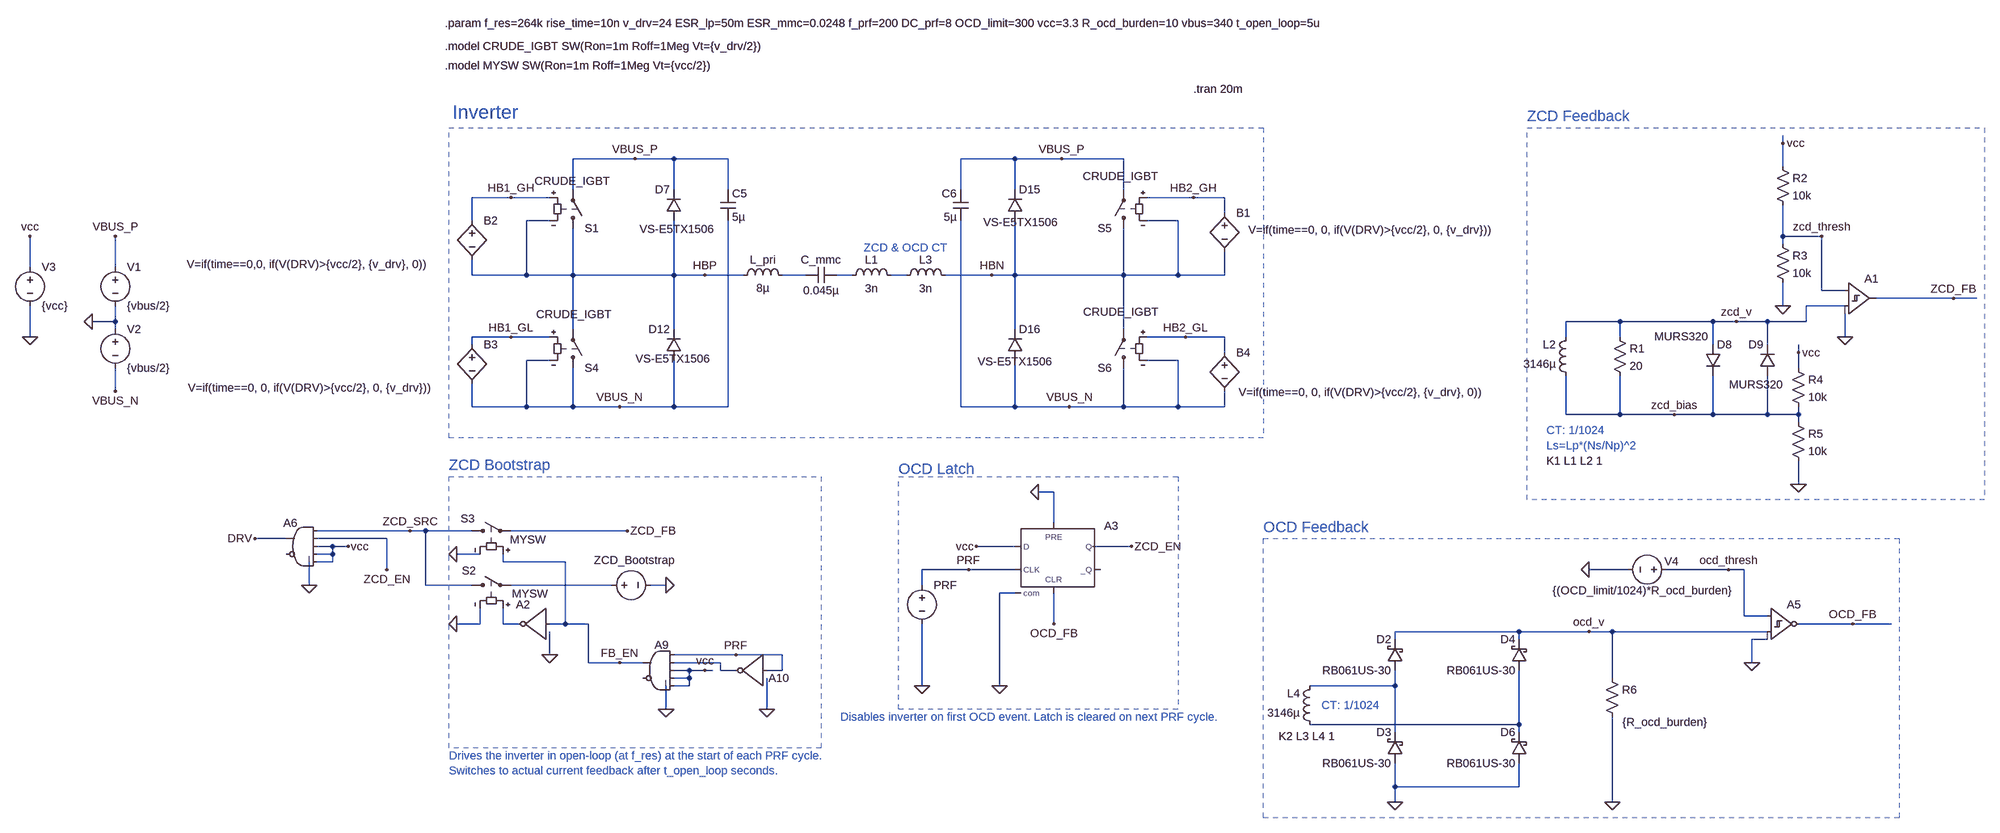
[diagram p0: schematic emma_mk1_drsstc_mmc_rms_current_sim_trans.asc]
emma_mk1_drsstc_mmc_rms_current_sim_trans.asc, the LTspice schematic file:
Version 4.1
SHEET 1 5796 1380
WIRE 4640 -1088 4640 -1104
WIRE 2272 -1056 2144 -1056
WIRE 2352 -1056 2272 -1056
WIRE 2464 -1056 2352 -1056
WIRE 3056 -1056 2944 -1056
WIRE 3152 -1056 3056 -1056
WIRE 3280 -1056 3152 -1056
WIRE 4640 -1040 4640 -1088
WIRE 2144 -992 2144 -1056
WIRE 2352 -992 2352 -1056
WIRE 2464 -992 2464 -1056
WIRE 2944 -992 2944 -1056
WIRE 3056 -992 3056 -1056
WIRE 3280 -992 3280 -1056
WIRE 2016 -976 1936 -976
WIRE 2096 -976 2016 -976
WIRE 3424 -976 3328 -976
WIRE 3488 -976 3424 -976
WIRE 3488 -944 3488 -976
WIRE 1936 -928 1936 -976
WIRE 2096 -928 2048 -928
WIRE 3392 -928 3328 -928
WIRE 4640 -896 4640 -960
WIRE 4720 -896 4640 -896
WIRE 4640 -880 4640 -896
WIRE 1024 -832 1024 -896
WIRE 1200 -832 1200 -896
WIRE 1936 -816 1936 -848
WIRE 2048 -816 2048 -928
WIRE 2048 -816 1936 -816
WIRE 2144 -816 2144 -912
WIRE 2144 -816 2048 -816
WIRE 2352 -816 2352 -928
WIRE 2352 -816 2144 -816
WIRE 2416 -816 2352 -816
WIRE 2496 -816 2416 -816
WIRE 2624 -816 2576 -816
WIRE 2720 -816 2688 -816
WIRE 2832 -816 2800 -816
WIRE 3008 -816 2912 -816
WIRE 3056 -816 3056 -928
WIRE 3056 -816 3008 -816
WIRE 3280 -816 3280 -912
WIRE 3280 -816 3056 -816
WIRE 3392 -816 3392 -928
WIRE 3392 -816 3280 -816
WIRE 3488 -816 3488 -864
WIRE 3488 -816 3392 -816
WIRE 4720 -784 4720 -896
WIRE 4768 -784 4720 -784
WIRE 4992 -768 4832 -768
WIRE 5040 -768 4992 -768
WIRE 4640 -752 4640 -800
WIRE 4768 -752 4688 -752
WIRE 1200 -720 1200 -752
WIRE 1200 -720 1152 -720
WIRE 4304 -720 4192 -720
WIRE 4496 -720 4304 -720
WIRE 4544 -720 4496 -720
WIRE 4608 -720 4544 -720
WIRE 4688 -720 4688 -752
WIRE 4688 -720 4608 -720
WIRE 1200 -704 1200 -720
WIRE 2144 -704 2144 -816
WIRE 2352 -704 2352 -816
WIRE 3056 -704 3056 -816
WIRE 3280 -704 3280 -816
WIRE 1024 -688 1024 -752
WIRE 2016 -688 1936 -688
WIRE 2096 -688 2016 -688
WIRE 3408 -688 3328 -688
WIRE 3488 -688 3408 -688
WIRE 4192 -688 4192 -720
WIRE 4304 -688 4304 -720
WIRE 4768 -688 4768 -736
WIRE 1936 -672 1936 -688
WIRE 4496 -672 4496 -720
WIRE 4608 -672 4608 -720
WIRE 3488 -656 3488 -688
WIRE 4672 -656 4672 -672
WIRE 2096 -640 2048 -640
WIRE 3392 -640 3328 -640
WIRE 4672 -624 4672 -656
WIRE 1200 -576 1200 -624
WIRE 1936 -544 1936 -592
WIRE 2048 -544 2048 -640
WIRE 2048 -544 1936 -544
WIRE 2144 -544 2144 -624
WIRE 2144 -544 2048 -544
WIRE 2240 -544 2144 -544
WIRE 2352 -544 2352 -640
WIRE 2352 -544 2240 -544
WIRE 2464 -544 2464 -928
WIRE 2464 -544 2352 -544
WIRE 2944 -544 2944 -928
WIRE 3056 -544 3056 -640
WIRE 3056 -544 2944 -544
WIRE 3168 -544 3056 -544
WIRE 3280 -544 3280 -624
WIRE 3280 -544 3168 -544
WIRE 3392 -544 3392 -640
WIRE 3392 -544 3280 -544
WIRE 3488 -544 3488 -576
WIRE 3488 -544 3392 -544
WIRE 4192 -528 4192 -608
WIRE 4304 -528 4304 -608
WIRE 4304 -528 4192 -528
WIRE 4416 -528 4304 -528
WIRE 4496 -528 4496 -608
WIRE 4496 -528 4416 -528
WIRE 4608 -528 4608 -608
WIRE 4608 -528 4496 -528
WIRE 4672 -528 4672 -544
WIRE 4672 -528 4608 -528
WIRE 4672 -512 4672 -528
WIRE 4672 -384 4672 -432
WIRE 3136 -368 3104 -368
WIRE 3136 -304 3136 -368
WIRE 1808 -288 1616 -288
WIRE 1840 -288 1808 -288
WIRE 1936 -288 1840 -288
WIRE 2256 -288 2016 -288
WIRE 1552 -272 1488 -272
WIRE 1760 -272 1616 -272
WIRE 1648 -256 1616 -256
WIRE 1680 -256 1648 -256
WIRE 3056 -256 2976 -256
WIRE 3296 -256 3216 -256
WIRE 1648 -240 1648 -256
WIRE 1648 -240 1616 -240
WIRE 1952 -240 1904 -240
WIRE 1648 -224 1648 -240
WIRE 1648 -224 1616 -224
WIRE 2000 -224 2000 -240
WIRE 2128 -224 2000 -224
WIRE 1760 -208 1760 -272
WIRE 2960 -208 2864 -208
WIRE 3056 -208 2960 -208
WIRE 4320 -208 4240 -208
WIRE 4528 -208 4400 -208
WIRE 4560 -208 4528 -208
WIRE 1600 -176 1600 -224
WIRE 1840 -176 1840 -288
WIRE 1936 -176 1840 -176
WIRE 2224 -176 2016 -176
WIRE 2336 -176 2304 -176
WIRE 2864 -176 2864 -208
WIRE 3056 -160 3024 -160
WIRE 4560 -112 4560 -208
WIRE 4608 -112 4560 -112
WIRE 1952 -96 1952 -128
WIRE 1952 -96 1904 -96
WIRE 2000 -96 2000 -128
WIRE 2032 -96 2000 -96
WIRE 2128 -96 2128 -224
WIRE 2128 -96 2096 -96
WIRE 2176 -96 2128 -96
WIRE 3136 -96 3136 -160
WIRE 4784 -96 4672 -96
WIRE 4864 -96 4784 -96
WIRE 4096 -80 3840 -80
WIRE 4240 -80 4096 -80
WIRE 4288 -80 4240 -80
WIRE 4608 -80 4288 -80
WIRE 3840 -64 3840 -80
WIRE 4096 -64 4096 -80
WIRE 4608 -64 4576 -64
WIRE 2096 -32 2096 -80
WIRE 2480 -32 2352 -32
WIRE 2576 -32 2480 -32
WIRE 2176 -16 2176 -96
WIRE 2240 -16 2176 -16
WIRE 2288 -16 2240 -16
WIRE 2448 -16 2352 -16
WIRE 4576 -16 4576 -64
WIRE 2384 0 2352 0
WIRE 2416 0 2384 0
WIRE 2432 0 2416 0
WIRE 2448 0 2448 -16
WIRE 2480 0 2448 0
WIRE 2576 0 2576 -32
WIRE 2576 0 2544 0
WIRE 2384 16 2384 0
WIRE 2384 16 2352 16
WIRE 4288 16 4288 -80
WIRE 2384 32 2384 16
WIRE 2384 32 2352 32
WIRE 2864 32 2864 -96
WIRE 3024 32 3024 -160
WIRE 3840 32 3840 0
WIRE 3840 32 3664 32
WIRE 2336 80 2336 32
WIRE 2544 80 2544 16
WIRE 4096 112 4096 0
WIRE 4096 112 3664 112
WIRE 3840 128 3840 32
WIRE 4096 128 4096 112
WIRE 3840 240 3840 192
WIRE 4096 240 4096 192
WIRE 4096 240 3840 240
WIRE 3840 272 3840 240
WIRE 4288 272 4288 96
FLAG 3008 -816 HBN
FLAG 2016 -976 HB1_GH
FLAG 2016 -688 HB1_GL
FLAG 3424 -976 HB2_GH
FLAG 3408 -688 HB2_GL
FLAG 2416 -816 HBP
FLAG 1152 -720 0
FLAG 2272 -1056 VBUS_P
FLAG 3152 -1056 VBUS_P
FLAG 1200 -896 VBUS_P
FLAG 1200 -576 VBUS_N
FLAG 2240 -544 VBUS_N
FLAG 3168 -544 VBUS_N
FLAG 1808 -288 ZCD_SRC
FLAG 4768 -688 0
FLAG 1024 -688 0
FLAG 1024 -896 vcc
FLAG 4640 -752 0
FLAG 4640 -1088 vcc
FLAG 4672 -384 0
FLAG 4672 -656 vcc
FLAG 4992 -768 ZCD_FB
FLAG 2256 -288 ZCD_FB
FLAG 4544 -720 zcd_v
FLAG 4416 -528 zcd_bias
FLAG 4720 -896 zcd_thresh
FLAG 4288 272 0
FLAG 4240 -80 ocd_v
FLAG 4784 -96 OCD_FB
FLAG 4528 -208 ocd_thresh
FLAG 4576 -16 0
FLAG 3024 32 0
FLAG 2960 -208 PRF
FLAG 3136 -96 OCD_FB
FLAG 2976 -256 vcc
FLAG 2864 32 0
FLAG 3840 272 0
FLAG 1600 -176 0
FLAG 1488 -272 DRV
FLAG 2336 80 0
FLAG 2416 0 vcc
FLAG 2544 80 0
FLAG 2480 -32 PRF
FLAG 2240 -16 FB_EN
FLAG 1680 -256 vcc
FLAG 2096 -32 0
FLAG 2336 -176 0
FLAG 1904 -240 0
FLAG 1904 -96 0
FLAG 3104 -368 0
FLAG 3296 -256 ZCD_EN
FLAG 1760 -208 ZCD_EN
FLAG 4240 -208 0
SYMBOL ind 2480 -800 R270
WINDOW 0 32 56 VTop 2
WINDOW 3 5 56 VBottom 2
SYMATTR InstName L_pri
SYMATTR Value 8µ
SYMATTR SpiceLine Rser={ESR_lp}
SYMBOL cap 2624 -800 R270
WINDOW 0 32 32 VTop 2
WINDOW 3 0 32 VBottom 2
SYMATTR InstName C_mmc
SYMATTR Value 0.045µ
SYMATTR SpiceLine Rser={ESR_mmc}
SYMBOL diode 2368 -928 R180
WINDOW 0 24 64 Left 2
WINDOW 3 -67 -17 Left 2
SYMATTR InstName D7
SYMATTR Value VS-E5TX1506
SYMBOL diode 2368 -640 R180
WINDOW 0 24 64 Left 2
WINDOW 3 -59 3 Left 2
SYMATTR InstName D12
SYMATTR Value VS-E5TX1506
SYMBOL cap 2448 -992 R0
SYMATTR InstName C5
SYMATTR Value 5µ
SYMBOL diode 3040 -928 M180
WINDOW 0 24 64 Left 2
WINDOW 3 -49 -3 Left 2
SYMATTR InstName D15
SYMATTR Value VS-E5TX1506
SYMBOL diode 3040 -640 M180
WINDOW 0 24 64 Left 2
WINDOW 3 -61 -3 Left 2
SYMATTR InstName D16
SYMATTR Value VS-E5TX1506
SYMBOL cap 2960 -992 M0
SYMATTR InstName C6
SYMATTR Value 5µ
SYMBOL bv 1936 -944 R0
WINDOW 3 -589 106 Left 2
SYMATTR Value V=if(time==0,0, if(V(DRV)>{vcc/2}, {v_drv}, 0))
SYMATTR InstName B2
SYMBOL bv 1936 -688 R0
WINDOW 3 -586 105 Left 2
SYMATTR Value V=if(time==0, 0, if(V(DRV)>{vcc/2}, 0, {v_drv}))
SYMATTR InstName B3
SYMBOL bv 3488 -960 R0
WINDOW 3 49 51 Left 2
SYMATTR Value V=if(time==0, 0, if(V(DRV)>{vcc/2}, 0, {v_drv}))
SYMATTR InstName B1
SYMBOL bv 3488 -672 R0
WINDOW 3 29 98 Left 2
SYMATTR Value V=if(time==0, 0, if(V(DRV)>{vcc/2}, {v_drv}, 0))
SYMATTR InstName B4
SYMBOL voltage 1200 -848 R0
WINDOW 123 0 0 Left 0
WINDOW 39 24 44 Left 2
SYMATTR InstName V1
SYMATTR Value {vbus/2}
SYMBOL voltage 1200 -720 R0
WINDOW 123 0 0 Left 0
WINDOW 39 24 44 Left 2
SYMATTR InstName V2
SYMATTR Value {vbus/2}
SYMBOL ind 2704 -800 R270
WINDOW 0 32 56 VTop 2
WINDOW 3 4 56 VBottom 2
SYMATTR InstName L1
SYMATTR Value 3n
SYMATTR Type ind
SYMATTR SpiceLine Rser=1m
SYMBOL ind 4208 -592 R180
WINDOW 0 36 80 Left 2
WINDOW 3 36 40 Left 2
SYMATTR InstName L2
SYMATTR Value 3146µ
SYMATTR Type ind
SYMATTR SpiceLine Rser=1m
SYMBOL res 4288 -704 R0
SYMATTR InstName R1
SYMATTR Value 20
SYMBOL sw 1920 -176 R270
WINDOW 0 30 -5 VRight 2
WINDOW 3 -18 98 VRight 2
SYMATTR InstName S2
SYMATTR Value MYSW
SYMBOL sw 1920 -288 R270
WINDOW 0 25 -8 VRight 2
WINDOW 3 -18 94 VRight 2
SYMATTR InstName S3
SYMATTR Value MYSW
SYMBOL Digital\\inv 2096 -160 M0
WINDOW 3 -508 207 Invisible 2
SYMATTR Value Vhigh={vcc} Vlow=0 Ref={vcc/2}Trise={rise_time} Tfall={rise_time}
SYMATTR InstName A2
SYMBOL voltage 2208 -176 R270
WINDOW 123 0 0 Left 0
WINDOW 39 0 0 Left 0
WINDOW 3 25 -17 Invisible 2
WINDOW 0 51 -21 VRight 2
SYMATTR Value PULSE(0 {vcc} 0 {rise_time} {rise_time} {0.5/{f_res}} {1/{f_res}})
SYMATTR InstName ZCD_Bootstrap
SYMBOL Digital\\diffschmtbuf 4768 -832 R0
WINDOW 3 1 -15 Invisible 2
SYMATTR Value vhigh={vcc} vlow=0 vt=0 vh=50m
SYMATTR InstName A1
SYMBOL voltage 1024 -848 R0
WINDOW 123 0 0 Left 0
WINDOW 39 0 0 Left 0
SYMATTR InstName V3
SYMATTR Value {vcc}
SYMBOL res 4624 -1056 R0
SYMATTR InstName R2
SYMATTR Value 10k
SYMBOL res 4624 -896 R0
SYMATTR InstName R3
SYMATTR Value 10k
SYMBOL res 4656 -640 R0
SYMATTR InstName R4
SYMATTR Value 10k
SYMBOL res 4656 -528 R0
SYMATTR InstName R5
SYMATTR Value 10k
SYMBOL res 4272 0 R0
WINDOW 3 37 107 Left 2
SYMATTR Value {R_ocd_burden}
SYMATTR InstName R6
SYMBOL schottky 3856 0 R180
WINDOW 0 24 64 Left 2
WINDOW 3 24 0 Left 2
SYMATTR InstName D2
SYMATTR Value RB061US-30
SYMATTR Description Diode
SYMATTR Type diode
SYMBOL schottky 3856 192 R180
WINDOW 0 24 64 Left 2
WINDOW 3 24 0 Left 2
SYMATTR InstName D3
SYMATTR Value RB061US-30
SYMATTR Description Diode
SYMATTR Type diode
SYMBOL schottky 4112 0 R180
WINDOW 0 24 64 Left 2
WINDOW 3 24 0 Left 2
SYMATTR InstName D4
SYMATTR Value RB061US-30
SYMATTR Description Diode
SYMATTR Type diode
SYMBOL schottky 4112 192 R180
WINDOW 0 24 64 Left 2
WINDOW 3 24 0 Left 2
SYMATTR InstName D6
SYMATTR Value RB061US-30
SYMATTR Description Diode
SYMATTR Type diode
SYMBOL voltage 4416 -208 R90
WINDOW 123 0 0 Left 0
WINDOW 39 0 0 Left 0
WINDOW 0 -17 -9 VRight 2
WINDOW 3 43 -120 VRight 2
SYMATTR InstName V4
SYMATTR Value {(OCD_limit/1024)*R_ocd_burden}
SYMBOL diode 4480 -672 R0
WINDOW 3 -105 -17 Left 2
SYMATTR Value MURS320
SYMATTR InstName D8
SYMBOL diode 4624 -608 R180
WINDOW 0 24 64 Left 2
WINDOW 3 -16 -18 Left 2
SYMATTR InstName D9
SYMATTR Value MURS320
SYMBOL ind 2816 -800 R270
WINDOW 0 32 56 VTop 2
WINDOW 3 4 56 VBottom 2
SYMATTR InstName L3
SYMATTR Value 3n
SYMATTR Type ind
SYMATTR SpiceLine Rser=1m
SYMBOL ind 3680 128 R180
WINDOW 0 36 80 Left 2
WINDOW 3 36 40 Left 2
SYMATTR InstName L4
SYMATTR Value 3146µ
SYMATTR Type ind
SYMATTR SpiceLine Rser=1m
SYMBOL voltage 2864 -192 R0
WINDOW 123 0 0 Left 0
WINDOW 39 0 0 Left 0
WINDOW 3 -941 57 Invisible 2
SYMATTR Value PULSE(0 {vcc} 0 {rise_time} {rise_time} {(1/f_prf)*(DC_prf/100)} {1/f_prf})
SYMATTR InstName PRF
SYMBOL Digital\\dflop 3136 -304 R0
WINDOW 3 56 -16 Invisible 2
SYMATTR Value Vhigh={vcc} Vlow=0 IC=0
SYMATTR InstName A3
SYMBOL Digital\\diffschmtinv 4608 -160 R0
WINDOW 3 64 17 Invisible 2
SYMATTR Value vhigh={vcc} vlow=0 vt=0 vh=50m
SYMATTR InstName A5
SYMBOL Digital\\and 1584 -320 M0
WINDOW 3 34 62 Invisible 2
SYMATTR Value Vhigh={vcc} Vlow=0
SYMATTR InstName A6
SYMBOL sw 2144 -896 M180
WINDOW 3 -79 114 Left 2
SYMATTR Value CRUDE_IGBT
SYMATTR InstName S1
SYMBOL sw 2144 -608 M180
WINDOW 3 -76 127 Left 2
SYMATTR Value CRUDE_IGBT
SYMATTR InstName S4
SYMBOL sw 3280 -896 R180
WINDOW 3 -70 124 Left 2
SYMATTR Value CRUDE_IGBT
SYMATTR InstName S5
SYMBOL sw 3280 -608 R180
WINDOW 3 -71 132 Left 2
SYMATTR Value CRUDE_IGBT
SYMATTR InstName S6
SYMBOL Digital\\and 2320 -64 M0
WINDOW 3 34 62 Invisible 2
WINDOW 0 -22 12 Left 2
SYMATTR Value Vhigh={vcc} Vlow=0
SYMATTR InstName A9
SYMBOL Digital\\inv 2544 -64 M0
WINDOW 3 -947 119 Invisible 2
WINDOW 0 -46 80 Left 2
SYMATTR Value Vhigh={vcc} Vlow=0 Ref={vcc/2}Trise={rise_time} Tfall={rise_time} Td={t_open_loop}
SYMATTR InstName A10
TEXT 1880 -1336 Left 2 !.param f_res=264k rise_time=10n v_drv=24 ESR_lp=50m ESR_mmc=0.0248 f_prf=200 DC_prf=8 OCD_limit=300 vcc=3.3 R_ocd_burden=10 vbus=340 t_open_loop=5u
TEXT 3424 -1200 Left 2 !.tran 20m
TEXT 4152 -432 Left 2 !K1 L1 L2 1
TEXT 4152 -464 Left 2 ;Ls=Lp*(Ns/Np)^2
TEXT 1880 -1248 Left 2 !.model MYSW SW(Ron=1m Roff=1Meg Vt={vcc/2})
TEXT 3600 136 Left 2 !K2 L3 L4 1
TEXT 1880 -1288 Left 2 !.model CRUDE_IGBT SW(Ron=1m Roff=1Meg Vt={v_drv/2})
TEXT 2744 -872 Left 2 ;ZCD & OCD CT
TEXT 1896 -1152 Left 4 ;Inverter
TEXT 4152 -496 Left 2 ;CT: 1/1024
TEXT 2816 -416 Left 3 ;OCD Latch
TEXT 2696 96 Left 2 ;Disables inverter on first OCD event. Latch is cleared on next PRF cycle.
TEXT 1888 -424 Left 3 ;ZCD Bootstrap
TEXT 1888 176 Left 2 ;Drives the inverter in open-loop (at f_res) at the start of each PRF cycle. \nSwitches to actual current feedback after t_open_loop seconds.
TEXT 3688 72 Left 2 ;CT: 1/1024
TEXT 3568 -296 Left 3 ;OCD Feedback
TEXT 4112 -1144 Left 3 ;ZCD Feedback
RECTANGLE Normal 3568 -480 1888 -1120 1
RECTANGLE Normal 3392 80 2816 -400 1
RECTANGLE Normal 2656 160 1888 -400 1
RECTANGLE Normal 4880 304 3568 -272 1
RECTANGLE Normal 5056 -352 4112 -1120 1

The netlist it stands for:
* emma_mk1_drsstc_mmc_rms_current_sim_trans.asc
L_pri HBP N001 8µ Rser={ESR_lp}
C_mmc N001 N002 0.045µ Rser={ESR_mmc}
D7 HBP VBUS_P VS-E5TX1506
D12 VBUS_N HBP VS-E5TX1506
C5 VBUS_P VBUS_N 5µ
D15 HBN VBUS_P VS-E5TX1506
D16 VBUS_N HBN VS-E5TX1506
C6 VBUS_P VBUS_N 5µ
B2 HB1_GH HBP V=if(time==0,0, if(V(DRV)>{vcc/2}, {v_drv}, 0))
B3 HB1_GL VBUS_N V=if(time==0, 0, if(V(DRV)>{vcc/2}, 0, {v_drv}))
B1 HB2_GH HBN V=if(time==0, 0, if(V(DRV)>{vcc/2}, 0, {v_drv}))
B4 HB2_GL VBUS_N V=if(time==0, 0, if(V(DRV)>{vcc/2}, {v_drv}, 0))
V1 VBUS_P 0 {vbus/2}
V2 0 VBUS_N {vbus/2}
L1 N002 N003 3n Rser=1m
L2 zcd_bias zcd_v 3146µ Rser=1m
R1 zcd_v zcd_bias 20
S2 ZCD_SRC N004 N005 0 MYSW
S3 ZCD_SRC ZCD_FB FB_EN 0 MYSW
A2 FB_EN 0 0 0 0 N005 0 0 BUF Vhigh={vcc} Vlow=0 Ref={vcc/2}Trise={rise_time} Tfall={rise_time}
V§ZCD_Bootstrap N004 0 PULSE(0 {vcc} 0 {rise_time} {rise_time} {0.5/{f_res}} {1/{f_res}})
A1 zcd_thresh zcd_v 0 0 0 0 ZCD_FB 0 SCHMITT vhigh={vcc} vlow=0 vt=0 vh=50m
V3 vcc 0 {vcc}
R2 vcc zcd_thresh 10k
R3 zcd_thresh 0 10k
R4 vcc zcd_bias 10k
R5 zcd_bias 0 10k
R6 ocd_v 0 {R_ocd_burden}
D2 N007 ocd_v RB061US-30
D3 0 N007 RB061US-30
D4 N008 ocd_v RB061US-30
D6 0 N008 RB061US-30
V4 ocd_thresh 0 {(OCD_limit/1024)*R_ocd_burden}
D8 zcd_v zcd_bias MURS320
D9 zcd_bias zcd_v MURS320
L3 N003 HBN 3n Rser=1m
L4 N008 N007 3146µ Rser=1m
V§PRF PRF 0 PULSE(0 {vcc} 0 {rise_time} {rise_time} {(1/f_prf)*(DC_prf/100)} {1/f_prf})
A3 vcc 0 PRF 0 OCD_FB 0 ZCD_EN 0 DFLOP Vhigh={vcc} Vlow=0 IC=0
A5 ocd_thresh ocd_v 0 0 0 OCD_FB 0 0 SCHMITT vhigh={vcc} vlow=0 vt=0 vh=50m
A6 ZCD_SRC ZCD_EN vcc vcc vcc 0 DRV 0 AND Vhigh={vcc} Vlow=0
S1 HBP VBUS_P HB1_GH HBP CRUDE_IGBT
S4 VBUS_N HBP HB1_GL VBUS_N CRUDE_IGBT
S5 HBN VBUS_P HB2_GH HBN CRUDE_IGBT
S6 VBUS_N HBN HB2_GL VBUS_N CRUDE_IGBT
A9 PRF N006 vcc vcc vcc 0 FB_EN 0 AND Vhigh={vcc} Vlow=0
A10 PRF 0 0 0 0 N006 0 0 BUF Vhigh={vcc} Vlow=0 Ref={vcc/2}Trise={rise_time} Tfall={rise_time} Td={t_open_loop}
.model D D
.lib standard.dio
.param f_res=264k rise_time=10n v_drv=24 ESR_lp=50m ESR_mmc=0.0248 f_prf=200 DC_prf=8 OCD_limit=300 vcc=3.3 R_ocd_burden=10 vbus=340 t_open_loop=5u
.tran 20m
K1 L1 L2 1
* Ls=Lp*(Ns/Np)^2
.model MYSW SW(Ron=1m Roff=1Meg Vt={vcc/2})
K2 L3 L4 1
.model CRUDE_IGBT SW(Ron=1m Roff=1Meg Vt={v_drv/2})
* ZCD & OCD CT
* Inverter
* CT: 1/1024
* OCD Latch
* Disables inverter on first OCD event. Latch is cleared on next PRF cycle.
* ZCD Bootstrap
* Drives the inverter in open-loop (at f_res) at the start of each PRF cycle.
* Switches to actual current feedback after t_open_loop seconds.
* CT: 1/1024
* OCD Feedback
* ZCD Feedback
.backanno
.end